# Altium schematic sheet Power_Switching_Circuit.SchDoc
size A; SheetNumber: 1; SheetTotal: 2
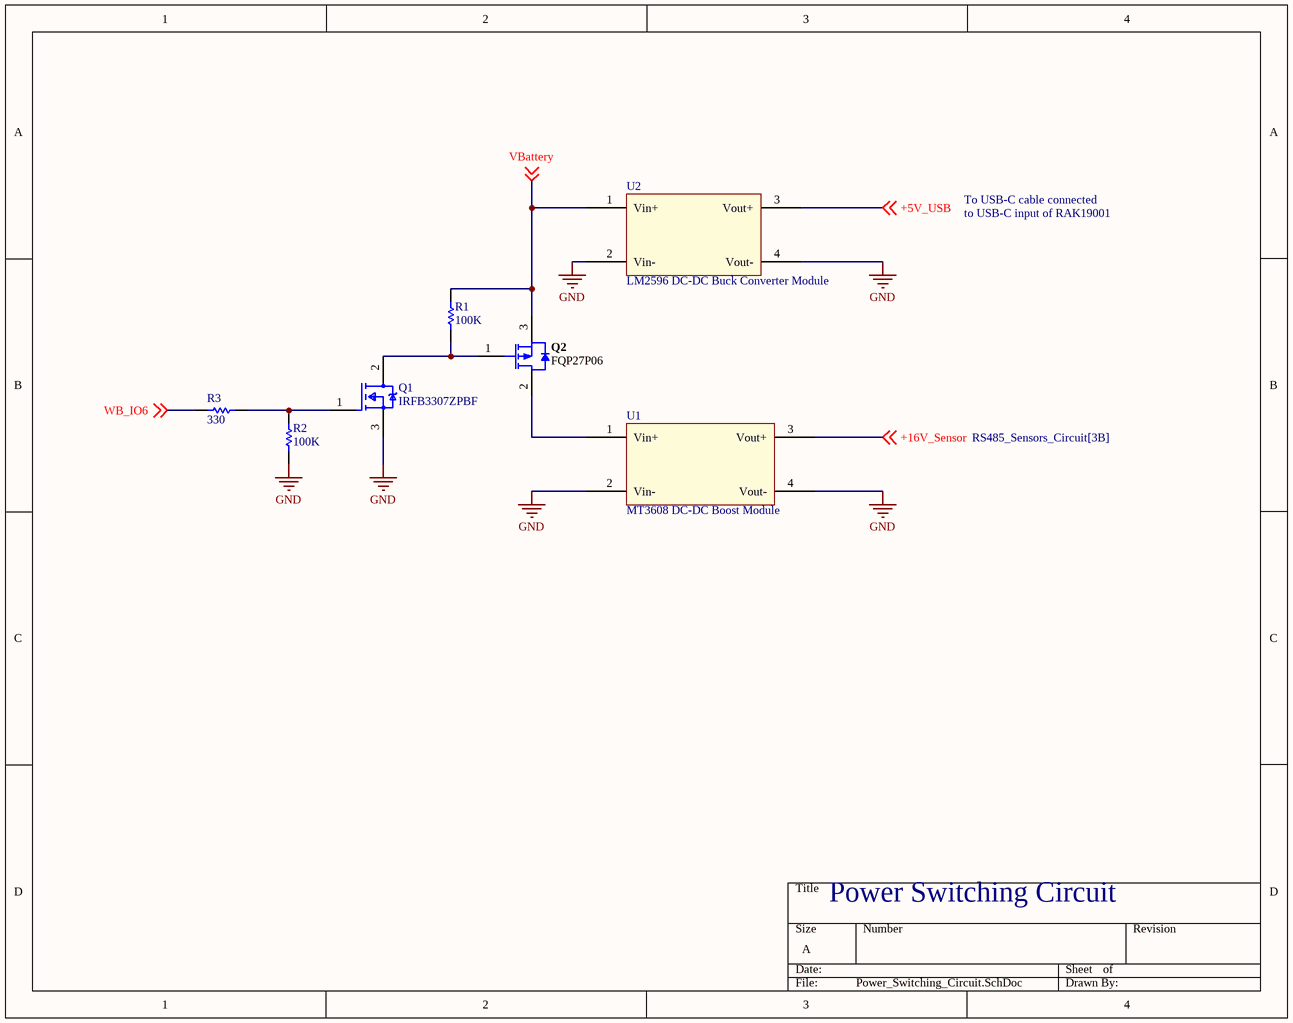
[diagram p0: Power_Switching_Circuit.SchDoc]

## Parts
Q1  IRFB3307ZPBF  [FP-PG-TO220-3-MFG]
Q2  FQP27P06  [FAIR-TO-220-3]
R1  value 100K  (hidden comment: Resistor)
R2  value 100K  (hidden comment: Resistor)
R3  value 330  (hidden comment: Resistor)
U1  MT3608 DC-DC Boost Module
U2  LM2596 DC-DC Buck Converter Module

## Nets
GND: Q1.3(S) R2.1 U1.2(Vin-) U1.4(Vout-) U2.2(Vin-) U2.4(Vout-)
+5V_USB: U2.3(Vout+) ; off-sheet +5V_USB
+16V_Sensor: U1.3(Vout+) ; off-sheet +16V_Sensor
VBattery: Q2.3(S) R1.2 U2.1(Vin+) ; off-sheet VBattery
WB_IO6: R3.1 ; off-sheet WB_IO6
NetQ1_1: Q1.1(G) R2.2 R3.2
NetQ1_2: Q1.2(D) Q2.1(G) R1.1
NetQ2_2: Q2.2(D) U1.1(Vin+)

## Notes on the sheet
- to USB-C input of RAK19001
- To USB-C cable connected
- Power Switching Circuit

## Library data of the parts
Q1 = CMP-32901-001051-1: MOSFET N-CH 75V 120A TO220AB; Gate to Source Voltage (Vgs): 20V; Max Power Dissipation: 230W; Input Capacitance: 4.75nF; Element Configuration: Single; Rise Time: 64ns; Turn-Off Delay Time: 38ns; Threshold Voltage: 4V; Drain to Source Resistance: 5.8mR; Turn-On Delay Time: 15ns; Packaging: Rail/Tube; Max Operating Temperature: 175°C; Min Operating Temperature: -55°C; Height: 0.65inch; Width: 0.19inch; Lead Free: Contains Lead; Continuous Drain Current (ID): 120A; Number of Pins: 3; RoHS Compliant: Yes; REACH SVHC: No SVHC; Length: 0.42inch; Max Dual Supply Voltage: 75V; Series: HEXFET®; Contact Plating: Tin; Case/Package: TO-220; Halogen Free: Halogen Free; Power Dissipation: 230W; Drain to Source Voltage (Vdss): 75V; Mount: Through Hole; Rds On Max: 5.8mR
Q2 = CMP-2000-04936-1: P-Channel QFET(R) MOSFET, -60 V, -27 A, -55 to 175 degC, 3-Pin TO-220, RoHS, Tube; Manufacturer: Fairchild; Rated Power Dissipation: 120W; Qg Gate Charge: 33nC; Drain-Source On Resistance-Max: 0.07O; Drain-to-Source Voltage [Vdss]: 60V; Package Reference: TO-220; Datasheet URL: https://www.fairchildsemi.com/datasheets/FQ/FQP27P06.pdf; Datasheet Version: Mar-13; Package Description: 3-Pin Through Hole Device, Body 10 x 4.5 mm, Pitch 2.54 mm; Package URL: https://www.fairchildsemi.com/package-drawings/TO/TO220B03.pdf; Channel Type: P-Channel; Manufacturer URL: https://www.fairchildsemi.com/
R1-R3 = Resistor: TC1: 0; SimulationGenericComponent: True; TC2: 0
U1 = MT3608_Module
U2 = LM2596_Module